# Altium schematic sheet Power_Controller-Sheet-ch4.SchDoc (part 1 of 3)
size 420 x 297 mm; SheetNumber: 9; SheetTotal: 10
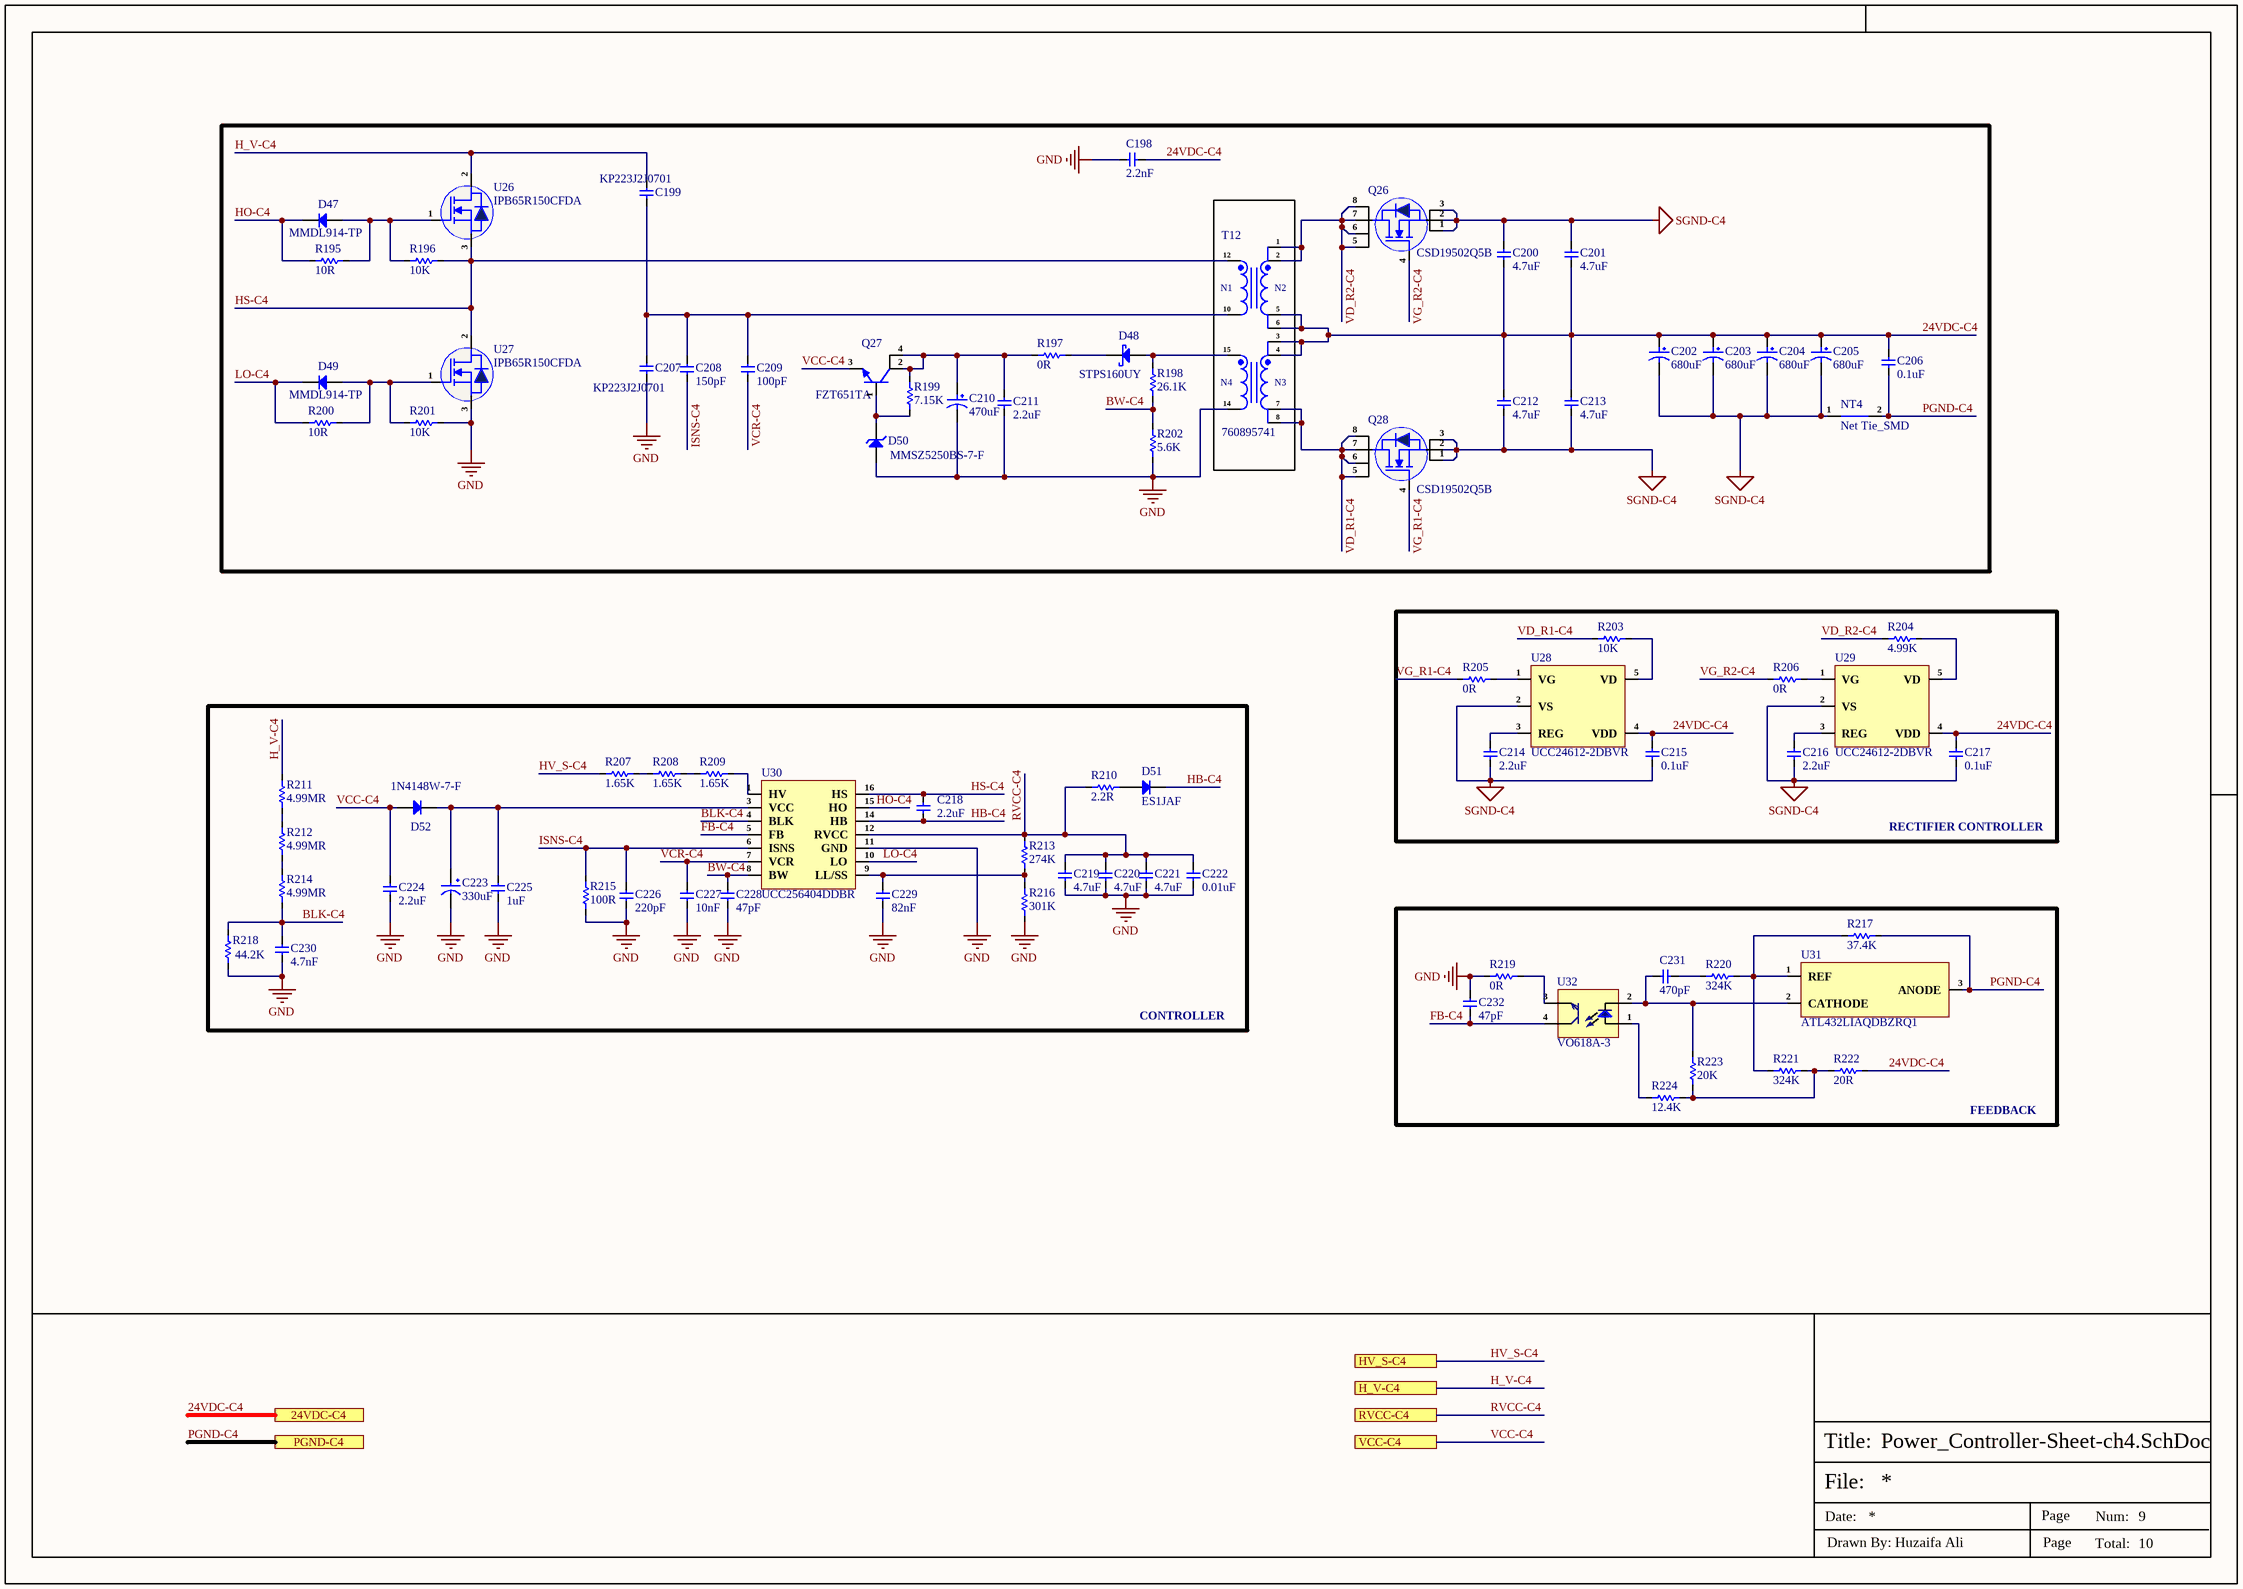
[diagram p0: Power_Controller-Sheet-ch4.SchDoc]

## Parts
C198  2.2nF  [DE1E3RA222MA4BN01F]
C199  KP223J2J0701  [KP223J2J0701]
C200  4.7uF  [Cap-1206]
C201  4.7uF  [Cap-1206]
C202  680uF  [EEU-FR1V681B]
C203  680uF  [EEU-FR1V681B]
C204  680uF  [EEU-FR1V681B]
C205  680uF  [EEU-FR1V681B]
C206  0.1uF  [Cap-1206]
C207  KP223J2J0701  [KP223J2J0701]
C208  150pF  [Cap-1206]
C209  100pF  [Cap-1206]
C210  470uF  [EEUFR1V471B]
C211  2.2uF  [Cap-1206]
C212  4.7uF  [Cap-1206]
C213  4.7uF  [Cap-1206]
C214  2.2uF  [CAP-0603]
C215  0.1uF  [Cap-1206]
C216  2.2uF  [CAP-0603]
C217  0.1uF  [Cap-1206]
C218  2.2uF  [Cap-1206]
C219  4.7uF  [Cap-0603]
C220  4.7uF  [Cap-0603]
C221  4.7uF  [Cap-0603]
C222  0.01uF  [Cap-0603]
C223  330uF  [RC035M331LO8*14TH-2A1E]
C224  2.2uF  [Cap-0603]
C225  1uF  [Cap-1206]
C226  220pF  [Cap-0603]
C227  10nF  [Cap-0603]
C228  47pF  [Cap-0402]
C229  82nF  [Cap-0603]
C230  4.7nF  [Cap-0603]
C231  470pF  [Cap-0603]
C232  47pF  [Cap-0603]
D47  MMDL914-TP  [SOD-323]
D48  STPS160UY  [SMB_]
D49  MMDL914-TP  [SOD-323]
D50  MMSZ5250BS-7-F  [SOD-323]
D51  ES1JAF  [DO-214AD (SMAF)]
D52  1N4148W-7-F  [SOD-123]
NT4  Net Tie_SMD  [Net Tie Pad]  (net tie, no BOM)
Q26  CSD19502Q5B  [VSON-CLIP-8(6x5)]
Q27  FZT651TA  [SOT- 223]
Q28  CSD19502Q5B  [VSON-CLIP-8(6x5)]
R195  10R  [Res-0603]
R196  10K  [RES-0805]
R197  0R  [Res-1206]
R198  26.1K  [Res-0603]
R199  7.15K  [Res-0603]
R200  10R  [Res-0603]
R201  10K  [RES-0805]
R202  5.6K  [RES-0805]
R203  10K  [Res-0603]
R204  4.99K  [Res-0603]
R205  0R  [Res-0402]
R206  0R  [Res-0402]
R207  1.65K  [Res-1206]
R208  1.65K  [Res-1206]
R209  1.65K  [Res-1206]
R210  2.2R  [Res-0603]
R211  4.99MR  [Res-1206]
R212  4.99MR  [Res-1206]
R213  274K  [Res-0603]
R214  4.99MR  [Res-1206]
R215  100R  [Res-0603]
R216  301K  [res-0603]
R217  37.4K  [Res-0603]
R218  44.2K  [Res-0603]
R219  0R  [Res-0603]
R220  324K  [Res-0603]
R221  324K  [Res-0603]
R222  20R  [Res-0603]
R223  20K  [Res-1206]
R224  12.4K  [Res-0603]
T12  760895741  [760895741]
U26  IPB65R150CFDA  [TO-263]
U27  IPB65R150CFDA  [TO-263]
U28  UCC24612-2DBVR  [SOT-23-5]
U29  UCC24612-2DBVR  [SOT-23-5]
U30  UCC256404DDBR  [UCC256404DDBR]
U31  ATL432LIAQDBZRQ1  [SOT-23]
U32  VO618A-3  [DIP-4]

## Blocks framed on the sheet
RECTIFIER CONTROLLER: C214-C217 R203-R206 U28 U29
CONTROLLER: C218-C230 D51 D52 R207-R216 R218 U30
FEEDBACK: C231 C232 R217 R219-R224 U31 U32

## Ports
24VDC-C4 (see Top-Sheet[6B], Connector-Sheet[4D]), H_V-C4 (see Top-Sheet[5B], PFC-Sheet-ch4[1D]), HV_S-C4 (see Top-Sheet[5B], PFC-Sheet-ch4[1D]), PGND-C4 (see Top-Sheet[6B], Connector-Sheet[4D]), RVCC-C4 (see Top-Sheet[5B], PFC-Sheet-ch4[1D]), VCC-C4 (see Top-Sheet[5C], PFC-Sheet-ch4[1D])

## Nets
GND: C198.1 C207.2 C210.2 C211.1 C219.1 C220.1 C221.1 C222.1 C223.2 C224.1 C225.2 C226.1 C227.1 C228.1 C229.1 C230.1 C232.2 D50.2(A) R201.2 R202.1 R215.1 R216.1 R218.1 R219.1 T12.14 U27.3(S) U30.11(GND)
SGND-C4: C200.2 C201.2 C202.2 C203.2 C204.2 C205.2 C212.1 C213.1 C214.1 C215.1 C216.1 C217.1 NT4.1 Q26.1(S) Q26.2(S) Q26.3(S) Q28.1(S) Q28.2(S) Q28.3(S) U28.2(VS) U29.2(VS)
24VDC-C4: C198.2 C200.1 C201.1 C202.1 C203.1 C204.1 C205.1 C206.2 C212.2 C213.2 C215.2 C217.2 R222.2 T12.3 T12.4 T12.5 T12.6 U28.4(VDD) U29.4(VDD) ; port 24VDC-C4
BLK-C4: C230.2 R214.1 R218.2 U30.4(BLK)
BW-C4: C228.2 R198.1 R202.2 U30.8(BW)
FB-C4: C232.1 U30.5(FB) U32.4(C)
H_V-C4: C199.1 R211.2 U26.2(D) ; port H_V-C4
HB-C4: C218.1 D51.1(K) U30.14(HB)
HO-C4: D47.1(K) R195.1 U30.15(HO)
HS-C4: C218.2 R196.2 T12.12 U26.3(S) U27.2(D) U30.16(HS)
HV_S-C4: R207.1 ; port HV_S-C4
ISNS-C4: C208.1 C226.2 R215.2 U30.6(ISNS)
LO-C4: D49.1(K) R200.1 U30.10(LO)
PGND-C4: C206.1 NT4.2 R217.2 U31.3(ANODE) ; port PGND-C4
RVCC-C4: C219.2 C220.2 C221.2 C222.2 R210.1 R213.2 U30.12(RVCC) ; port RVCC-C4
VCC-C4: C224.2 D52.1(A) Q27.3(E) ; port VCC-C4
VCR-C4: C209.1 C227.2 U30.7(VCR)
VD_R1-C4: Q28.5(D) Q28.6(D) Q28.7(D) Q28.8(D) R203.1 T12.7 T12.8
VD_R2-C4: Q26.5(D) Q26.6(D) Q26.7(D) Q26.8(D) R204.1 T12.1 T12.2
VG_R1-C4: Q28.4(G) R205.1
VG_R2-C4: Q26.4(G) R206.1
NetC199_2: C199.2 C207.1 C208.2 C209.2 T12.10
NetC210_1: C210.1 C211.2 Q27.2(C) Q27.4(C) R197.1 R199.2
NetC214_2: C214.2 U28.3(REG)
NetC216_2: C216.2 U29.3(REG)
NetC223_1: C223.1 C225.1 D52.2(K) U30.3(VCC)
NetC229_2: C229.2 R213.1 R216.2 U30.9(LL/SS)
NetC231_1: C231.1 R223.2 U31.2(CATHODE) U32.2(Ca)
NetC231_2: C231.2 R220.1
NetD47_2: D47.2(A) R195.2 R196.1 U26.1(G)
NetD48_1: D48.1(A) R198.2 T12.15
NetD48_2: D48.2(K) R197.2
NetD49_2: D49.2(A) R200.2 R201.1 U27.1(G)
NetD50_1: D50.1(K) Q27.1(B) R199.1
NetD51_2: D51.2(A) R210.2
NetR203_2: R203.2 U28.5(VD)
NetR204_2: R204.2 U29.5(VD)
NetR205_2: R205.2 U28.1(VG)
NetR206_2: R206.2 U29.1(VG)
NetR207_2: R207.2 R208.1
NetR208_2: R208.2 R209.1
NetR209_2: R209.2 U30.1(HV)
NetR211_1: R211.1 R212.2
NetR212_1: R212.1 R214.2
NetR217_1: R217.1 R220.2 R221.1 U31.1(REF)
NetR219_2: R219.2 U32.3(E)
NetR221_2: R221.2 R222.1 R223.1 R224.2
NetR224_1: R224.1 U32.1(An)

## Notes on the sheet
- File:
- Title:
- Date:
- Page
- Num:
- Total:
- Drawn By: Huzaifa Ali
- (in symbol 760895741) N1; N2; N4; N3